# Altium schematic sheet CW341_FPGA_PWR.SchDoc: Kintex Power Connections
size Letter; Organization: NewAE Technology Inc.; Address1: 1083 Queen St., Suite 196; Address2: Halifax; Address3: NS; Address4: Canada B3H 0B2; SheetNumber: 3; SheetTotal: 16; SheetApproved: YES
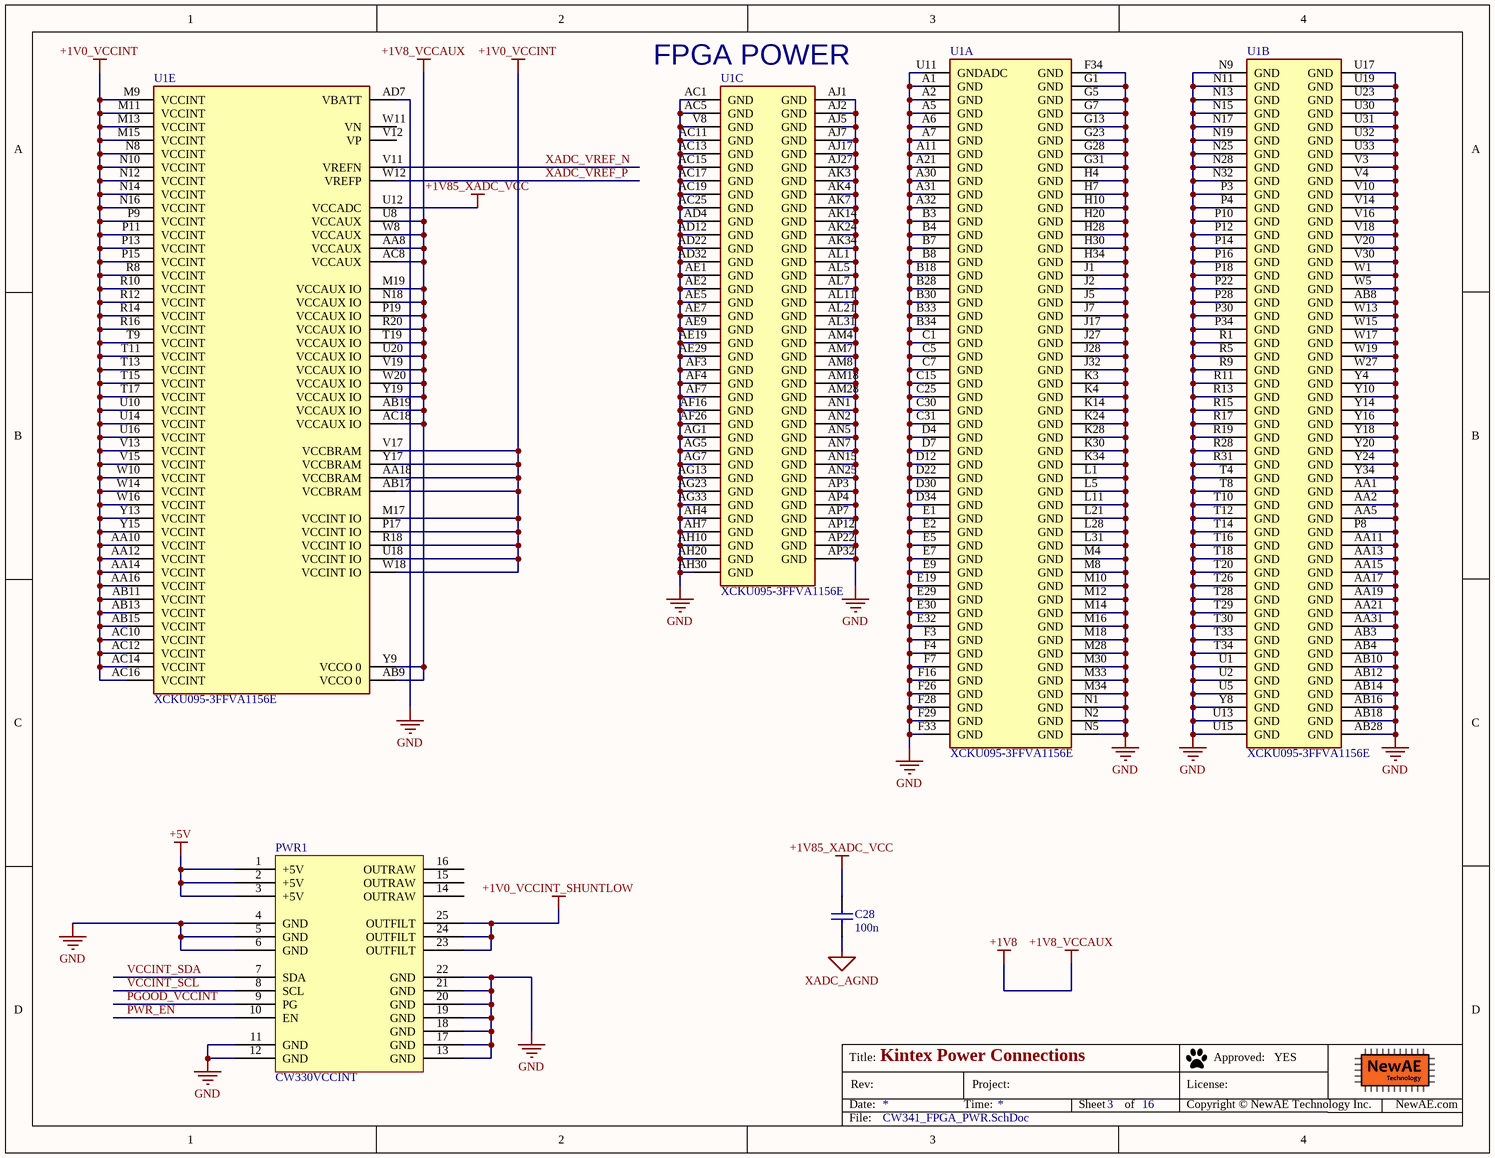
[diagram p0: CW341_FPGA_PWR.SchDoc]

## Parts
C28  100n  [CAPC0402_M]
PWR1  CW330VCCINT  [CW335_VCCINT_POWERSUPPLY]
U1  XCKU095-3FFVA1156E  [FP-XCKU060-3FFVA1156E-MFG]  (parts A,B,C,E of 23)

## Nets
+1V0_VCCINT: U1.AA10(VCCINT) U1.AA12(VCCINT) U1.AA14(VCCINT) U1.AA16(VCCINT) U1.AA18(VCCBRAM) U1.AB11(VCCINT) U1.AB13(VCCINT) U1.AB15(VCCINT) U1.AB17(VCCBRAM) U1.AC10(VCCINT) U1.AC12(VCCINT) U1.AC14(VCCINT) U1.AC16(VCCINT) U1.M9(VCCINT) U1.M11(VCCINT) U1.M13(VCCINT) U1.M15(VCCINT) U1.M17(VCCINT_IO) U1.N8(VCCINT) U1.N10(VCCINT) U1.N12(VCCINT) U1.N14(VCCINT) U1.N16(VCCINT) U1.P9(VCCINT) U1.P11(VCCINT) U1.P13(VCCINT) U1.P15(VCCINT) U1.P17(VCCINT_IO) U1.R8(VCCINT) U1.R10(VCCINT) U1.R12(VCCINT) U1.R14(VCCINT) U1.R16(VCCINT) U1.R18(VCCINT_IO) U1.T9(VCCINT) U1.T11(VCCINT) U1.T13(VCCINT) U1.T15(VCCINT) U1.T17(VCCINT) U1.U10(VCCINT) U1.U14(VCCINT) U1.U16(VCCINT) U1.U18(VCCINT_IO) U1.V13(VCCINT) U1.V15(VCCINT) U1.V17(VCCBRAM) U1.W10(VCCINT) U1.W14(VCCINT) U1.W16(VCCINT) U1.W18(VCCINT_IO) U1.Y13(VCCINT) U1.Y15(VCCINT) U1.Y17(VCCBRAM)
+1V0_VCCINT_SHUNTLOW: PWR1.23(OUTFILT) PWR1.24(OUTFILT) PWR1.25(OUTFILT)
+1V8: U1.AA8(VCCAUX) U1.AB9(VCCO_0) U1.AB19(VCCAUX_IO) U1.AC8(VCCAUX) U1.AC18(VCCAUX_IO) U1.M19(VCCAUX_IO) U1.N18(VCCAUX_IO) U1.P19(VCCAUX_IO) U1.R20(VCCAUX_IO) U1.T19(VCCAUX_IO) U1.U8(VCCAUX) U1.U20(VCCAUX_IO) U1.V19(VCCAUX_IO) U1.W8(VCCAUX) U1.W20(VCCAUX_IO) U1.Y9(VCCO_0) U1.Y19(VCCAUX_IO)  [also labelled +1V8_VCCAUX]
+1V85_XADC_VCC: C28.1 U1.U12(VCCADC)
+5V: PWR1.1(+5V) PWR1.2(+5V) PWR1.3(+5V)
GND: PWR1.4(GND) PWR1.5(GND) PWR1.6(GND) PWR1.11(GND) PWR1.12(GND) PWR1.13(GND) PWR1.17(GND) PWR1.18(GND) PWR1.19(GND) PWR1.20(GND) PWR1.21(GND) PWR1.22(GND) U1.A1(GND) U1.A2(GND) U1.A5(GND) U1.A6(GND) U1.A7(GND) U1.A11(GND) U1.A21(GND) U1.A30(GND) U1.A31(GND) U1.A32(GND) U1.AA1(GND) U1.AA2(GND) U1.AA5(GND) U1.AA11(GND) U1.AA13(GND) U1.AA15(GND) U1.AA17(GND) U1.AA19(GND) U1.AA21(GND) U1.AA31(GND) U1.AB3(GND) U1.AB4(GND) U1.AB8(GND) U1.AB10(GND) U1.AB12(GND) U1.AB14(GND) U1.AB16(GND) U1.AB18(GND) U1.AB28(GND) U1.AC1(GND) U1.AC5(GND) U1.AC11(GND) U1.AC13(GND) U1.AC15(GND) U1.AC17(GND) U1.AC19(GND) U1.AC25(GND) U1.AD4(GND) U1.AD7(VBATT) U1.AD12(GND) U1.AD22(GND) U1.AD32(GND) U1.AE1(GND) U1.AE2(GND) U1.AE5(GND) U1.AE7(GND) U1.AE9(GND) U1.AE19(GND) U1.AE29(GND) U1.AF3(GND) U1.AF4(GND) U1.AF7(GND) U1.AF16(GND) U1.AF26(GND) U1.AG1(GND) U1.AG5(GND) U1.AG7(GND) U1.AG13(GND) U1.AG23(GND) U1.AG33(GND) U1.AH4(GND) U1.AH7(GND) U1.AH10(GND) U1.AH20(GND) U1.AH30(GND) U1.AJ1(GND) U1.AJ2(GND) U1.AJ5(GND) U1.AJ7(GND) U1.AJ17(GND) U1.AJ27(GND) U1.AK3(GND) U1.AK4(GND) U1.AK7(GND) U1.AK14(GND) U1.AK24(GND) U1.AK34(GND) U1.AL1(GND) U1.AL5(GND) U1.AL7(GND) U1.AL11(GND) U1.AL21(GND) U1.AL31(GND) U1.AM4(GND) U1.AM7(GND) U1.AM8(GND) U1.AM18(GND) U1.AM28(GND) U1.AN1(GND) U1.AN2(GND) U1.AN5(GND) U1.AN7(GND) U1.AN15(GND) U1.AN25(GND) U1.AP3(GND) U1.AP4(GND) U1.AP7(GND) U1.AP12(GND) U1.AP22(GND) U1.AP32(GND) U1.B3(GND) U1.B4(GND) U1.B7(GND) U1.B8(GND) U1.B18(GND) U1.B28(GND) U1.B30(GND) U1.B33(GND) U1.B34(GND) U1.C1(GND) U1.C5(GND) U1.C7(GND) U1.C15(GND) U1.C25(GND) U1.C30(GND) U1.C31(GND) U1.D4(GND) U1.D7(GND) U1.D12(GND) U1.D22(GND) U1.D30(GND) U1.D34(GND) U1.E1(GND) U1.E2(GND) U1.E5(GND) U1.E7(GND) U1.E9(GND) U1.E19(GND) U1.E29(GND) U1.E30(GND) U1.E32(GND) U1.F3(GND) U1.F4(GND) U1.F7(GND) U1.F16(GND) U1.F26(GND) U1.F28(GND) U1.F29(GND) U1.F33(GND) U1.F34(GND) U1.G1(GND) U1.G5(GND) U1.G7(GND) U1.G13(GND) U1.G23(GND) U1.G28(GND) U1.G31(GND) U1.H4(GND) U1.H7(GND) U1.H10(GND) U1.H20(GND) U1.H28(GND) U1.H30(GND) U1.H34(GND) U1.J1(GND) U1.J2(GND) U1.J5(GND) U1.J7(GND) U1.J17(GND) U1.J27(GND) U1.J28(GND) U1.J32(GND) U1.K3(GND) U1.K4(GND) U1.K14(GND) U1.K24(GND) U1.K28(GND) U1.K30(GND) U1.K34(GND) U1.L1(GND) U1.L5(GND) U1.L11(GND) U1.L21(GND) U1.L28(GND) U1.L31(GND) U1.M4(GND) U1.M8(GND) U1.M10(GND) U1.M12(GND) U1.M14(GND) U1.M16(GND) U1.M18(GND) U1.M28(GND) U1.M30(GND) U1.M33(GND) U1.M34(GND) U1.N1(GND) U1.N2(GND) U1.N5(GND) U1.N9(GND) U1.N11(GND) U1.N13(GND) U1.N15(GND) U1.N17(GND) U1.N19(GND) U1.N25(GND) U1.N28(GND) U1.N32(GND) U1.P3(GND) U1.P4(GND) U1.P8(GND) U1.P10(GND) U1.P12(GND) U1.P14(GND) U1.P16(GND) U1.P18(GND) U1.P22(GND) U1.P28(GND) U1.P30(GND) U1.P34(GND) U1.R1(GND) U1.R5(GND) U1.R9(GND) U1.R11(GND) U1.R13(GND) U1.R15(GND) U1.R17(GND) U1.R19(GND) U1.R28(GND) U1.R31(GND) U1.T4(GND) U1.T8(GND) U1.T10(GND) U1.T12(GND) U1.T14(GND) U1.T16(GND) U1.T18(GND) U1.T20(GND) U1.T26(GND) U1.T28(GND) U1.T29(GND) U1.T30(GND) U1.T33(GND) U1.T34(GND) U1.U1(GND) U1.U2(GND) U1.U5(GND) U1.U11(GNDADC) U1.U13(GND) U1.U15(GND) U1.U17(GND) U1.U19(GND) U1.U23(GND) U1.U30(GND) U1.U31(GND) U1.U32(GND) U1.U33(GND) U1.V3(GND) U1.V4(GND) U1.V8(GND) U1.V10(GND) U1.V14(GND) U1.V16(GND) U1.V18(GND) U1.V20(GND) U1.V30(GND) U1.W1(GND) U1.W5(GND) U1.W13(GND) U1.W15(GND) U1.W17(GND) U1.W19(GND) U1.W27(GND) U1.Y4(GND) U1.Y8(GND) U1.Y10(GND) U1.Y14(GND) U1.Y16(GND) U1.Y18(GND) U1.Y20(GND) U1.Y24(GND) U1.Y34(GND)
XADC_AGND: C28.2
PGOOD_VCCINT: PWR1.9(PG)
PWR_EN: PWR1.10(EN)
VCCINT_SCL: PWR1.8(SCL)
VCCINT_SDA: PWR1.7(SDA)
XADC_VREF_N: U1.V11(VREFN)
XADC_VREF_P: U1.W12(VREFP)

Not connected (* = marked no-connect by the designer): PWR1 14(OUTRAW) 15(OUTRAW) 16(OUTRAW); U1 V12(VP) W11(VN)

## Notes on the sheet
- (near U1) FPGA POWER
- Title:
- Date:
- Rev:
- Time:
- Project:
- Sheet
- of
- License:
- Copyright © NewAE Technology Inc.
- Approved:
- NewAE.com
- File:

## Library data of the parts
C28 = CCHIP-100n-0402: 100n, 0402; Manufacture Part Number 1: CGA2B3X7R1V104K050BB; Component Group: Capacitor; Case-EIA: 0402; Part Number: CCHIP-100n-0402; Footprint: 0402; Pin Count: 2; Value: 100n; Mounting Technology: SMT; Component Kind: Standard; Component Type: Standard; Supplier 1: Digi-Key; Supplier Part Number 1: 445-6901-1-ND
U1 = IC-XCKU095-1156: IC FPGA 520 I/O 1156FCBGA; Manufacturer: Xilinx; Manufacturer Part Number: XCKU060-3FFVA1156E; Standoff Height: 0.4mm; Ram Size: 38MBytes; Min Supply Voltage: 0.97V; Max Junction Temp: +100°C; Max Supply Voltage: 1.8V; Number Of Logic Elements Cells: 1176000; Number Of I/Os: 520; Speed Grade: 3; Memory Type: RAM; Ipc Land Pattern Name: BGA1156N100P34X34_3500X3500X342; RoHS: TRUE; Height: 3.51mm; Footprint Url: https://www.xilinx.com/support/documentation/user_guides/ug575-ultrascale-pkg-pinout.pdf; Device Class L2: Embedded Processors and Controllers; ComponentLink2URL: https://www.xilinx.com/support/documentation/data_sheets/ds890-ultrascale-overview.pdf; Temperature Range High: +100°C; Device Class L1: Integrated Circuits (ICs); Package: 0; Octopart: https://octopart.com/xcku035-3ffva1156e-xilinx-67038192?r=sp; Automotive: No; ComponentLink2Description: Datasheet; Device Class L3: FPGAs - Field Programmable Gate Arrays; Category: IC; Lead Free: Yes; Temperature: 0°C to +100°C; Temperature Range Low: 0°C; Digikey Description: IC FPGA 520 I/O 1156FCBGA